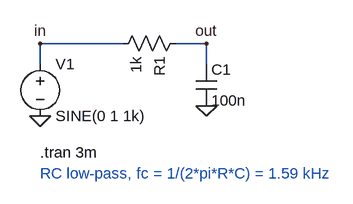
[diagram p0: schematic rc_transient.asc]
rc_transient.asc, the LTspice schematic file:
Version 4
SHEET 1 880 680
WIRE -32 64 96 64
WIRE 224 64 176 64
WIRE 224 96 224 64
WIRE -32 96 -32 64
FLAG -32 176 0
FLAG 224 160 0
FLAG 224 64 out
FLAG -32 64 in
SYMBOL voltage -32 80 R0
SYMATTR InstName V1
SYMATTR Value SINE(0 1 1k)
SYMBOL res 192 48 R90
SYMATTR InstName R1
SYMATTR Value 1k
SYMBOL cap 208 96 R0
SYMATTR InstName C1
SYMATTR Value 100n
TEXT -32 232 Left 2 !.tran 3m
TEXT -32 264 Left 2 ;RC low-pass, fc = 1/(2*pi*R*C) = 1.59 kHz

The netlist it stands for:
* rc_transient.asc
V1 in 0 SINE(0 1 1k)
R1 out in 1k
C1 out 0 100n
.tran 3m
* RC low-pass, fc = 1/(2*pi*R*C) = 1.59 kHz
.backanno
.end